# Altium schematic sheet 6.Connectors.SchDoc
size A4; DocumentNumber: 6; SheetNumber: 6
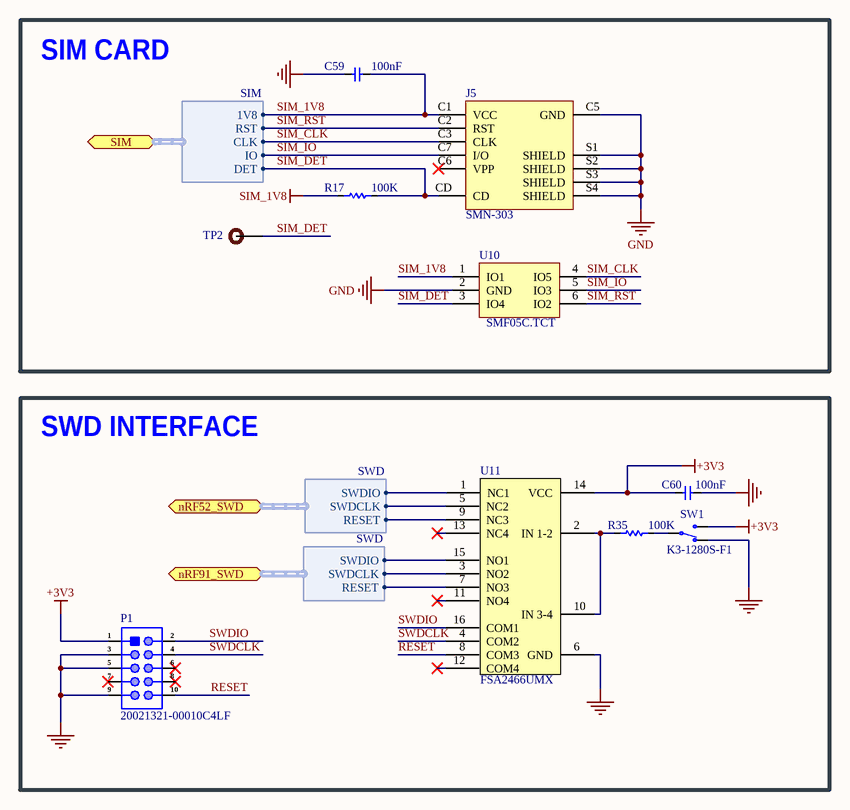
[diagram p0: 6.Connectors.SchDoc]

## Parts
C59  100nF  [cap-0402]
C60  100nF  [cap-0402]
J5  SMN-303  [XUNPU_SMN-303]
P1  20021321-00010C4LF  [20021321-00010C4LF]
R17  100K  [Res-0402]
R35  100K  [Res-0402]
SW1  K3-1280S-F1  [K3-1280S-F1]
TP2  TEST POINT 0.5mm Dia  [Test-point - 0.5mm]  (value not drawn)  (no BOM)
U10  SMF05C.TCT  [SOT65P210X110-6N]
U11  FSA2466UMX  [XQFN40P180X260X50-16N]

## Blocks framed on the sheet
SIM CARD: C59 J5 R17 TP2 U10
SWD INTERFACE: C60 P1 R35 SW1 U11

## Ports
nRF52_SWD (bidir, harness SWD), nRF91_SWD (bidir, harness SWD), SIM (bidir, harness SIM)

## Harnesses
SIM: DET, RST, CLK, IO, 1V8
SWD: SWDIO, SWDCLK, RESET

## Nets
+3V3: C60.1 P1.1 SW1.3(N.O) U11.14(VCC)
GND: C59.1 C60.2 J5.C5(GND) J5.S1(SHIELD) J5.S2(SHIELD) J5.S3(SHIELD) J5.S4(SHIELD) P1.3 P1.5 P1.9 SW1.1(N.C) U10.2(GND) U11.6(GND)
SIM_1V8: C59.2 J5.C1(VCC) R17.1 U10.1(IO1) ; port SIM.1V8
RESET: P1.10 U11.8(COM3)
SIM_CLK: J5.C3(CLK) U10.4(IO5) ; port SIM.CLK
SIM_DET: J5.CD R17.2 TP2.1 U10.3(IO4) ; port SIM.DET
SIM_IO: J5.C7(I/O) U10.5(IO3) ; port SIM.IO
SIM_RST: J5.C2(RST) U10.6(IO2) ; port SIM.RST
SWDCLK: P1.4 U11.4(COM2)
SWDIO: P1.2 U11.16(COM1)
NetR35_1: R35.1 U11.2(IN_1-2) U11.10(IN_3-4)
NetR35_2: R35.2 SW1.2(COM)
NetU11_1: U11.1(NC1) ; port nRF52_SWD.SWDIO
NetU11_3: U11.3(NO2) ; port nRF91_SWD.SWDCLK
NetU11_5: U11.5(NC2) ; port nRF52_SWD.SWDCLK
NetU11_7: U11.7(NO3) ; port nRF91_SWD.RESET
NetU11_9: U11.9(NC3) ; port nRF52_SWD.RESET
NetU11_15: U11.15(NO1) ; port nRF91_SWD.SWDIO

Not connected (* = marked no-connect by the designer): J5 C6(VPP)*; P1 6* 7* 8*; U11 11(NO4)* 12(COM4)* 13(NC4)*

## Notes on the sheet
- ZyntelliTech
- File:
- Title:
- Date:
- Page
- Num:
- Total:
- Drawn By: Huzaifa Ali

## Library data of the parts
C59 C60 = C1005X7R1H104KT000F: CAP CER 0.1UF 50V X7R 0402; Manufacturer: TDK; Tolerance: 10%; Voltage: 25V; Item Type: Capacitor; ComponentLink1URL: https://www.lcsc.com/product-detail/Multilayer-Ceramic-Capacitors-MLCC-SMD-SMT_TDK-C1005X7R1H104KT000F_C361198.html; ComponentLink1Description: LCSC; Supplier 1: Avnet; Manufacturer Part Number: C1005X7R1H104KT000F; RoHS: No; Category: Ceramic Capacitors; Dielectric: X7R; Supplier Part Number 1: C1005X7R1H104KT000F; LCSC Part Number: C361198
J5 = SMN-303: NanoSIM SMD SIM Card Connectors; Manufacturer: XUNPU; Alternate Part Number: SIM8066-6-1-14-01-A; Manufacturer Part Number: SMN-303; Supplier 1: LCSC; LCSC: C266888
P1 = 20021321-00010C4LF: CONN RCPT 10POS 0.05 GOLD SMD; Manufacturer: Amphenol Communications Solutions; Item Type: Headers and Wire Housings; Gender: 4472Gender; Connector Type: 4640ConnectorType; Current Rating: 1A; Number of Contacts: 10NUMBER; Voltage Rating: 125V; Contact Resistance: 30mR; Insulation Resistance: 100MR; Pitch: 1.27mm; Stack Height: 4.3mm; Supplier: Digikey; LCSC Part Number: C598542; Manufacturer Part Number: 20021321-00010C4LF; RoHS: No; Stock: 9747; Pricing: 1=1.13, 10=0.963, 100=0.8184 (USD); Mounting Technology: 8Mount; Pins: 10NUMBER; Color: 46Colour; Contact Material: 153,157ConductorMaterial; Contact Plating: 157ConductorMaterial; Housing Color: 46Colour; Housing Material: 4896ConductorMaterial; Min Operating Temperature: -55°C; Max Operating Temperature: 125°C; Number of Positions: 10NUMBER; Number of Rows: 2NUMBER; Packaging: 10Packaging; Termination: 4558ConnectorType; Max Voltage Rating (AC): 125V; Length: 13.16mm; Height: 4.75mm; Depth: 3mm; Row Spacing: 1.27mm; Lead Free: 5697LeadFree; Reach SVHC Compliant: 4186SVHC; ComponentLink1URL: https://datasheet.octopart.com/20021321-00010C4LF-FCI-datasheet-27119701.pdf?src-supplier=Newark; ComponentLink1Description: https://datasheet.octopart.com/20021321-00010C4LF-FCI-datasheet-27119701.pdf?src-supplier=Newark; ComponentLink2URL: https://datasheet.octopart.com/20021321-00010C4LF-Amphenol-Communications-Solutions-datasheet-98396828.pdf?src-supplier=Element14; ComponentLink2Description: https://datasheet.octopart.com/20021321-00010C4LF-Amphenol-Communications-Solutions-datasheet-98396828.pdf?src-supplier=Element14; ComponentLink3URL: https://datasheet.octopart.com/20021321-00010C4LF-FCI-datasheet-21379677.pdf?src-supplier=Farnell; ComponentLink3Description: https://datasheet.octopart.com/20021321-00010C4LF-FCI-datasheet-21379677.pdf?src-supplier=Farnell; ComponentLink4URL: https://datasheet.octopart.com/20021321-00010C4LF-Amphenol-Communications-Solutions-datasheet-100449241.pdf?src-supplier=TME; ComponentLink4Description: https://datasheet.octopart.com/20021321-00010C4LF-Amphenol-Communications-Solutions-datasheet-100449241.pdf?src-supplier=TME
R17 R35 = RC0402FR-07100KL: RES 100K OHM 1% 1/16W 0402; Manufacturer: Yageo; Temperature Coefficient: 100ppm/°C; Power Rating: 63mW; Voltage Rating: 50V; Item Type: Resistor; Resistance: 100kR; RoHS: Yes; Category: Chip SMD Resistors; Case/Package: 0402; Case Code (Metric): 1005; Case Code (Imperial): 0402; Min Operating Temperature: -55°C; Max Operating Temperature: 155°C; Resistor Type: Thick Film; Tolerance: 1%; Packaging: Tape and Reel; Features: Moisture Resistant; Resistance Tolerance: 1%; Height: 0.016inch; Lead Free: Lead Free; RoHS Compliant: Yes; ComponentLink1URL: https://datasheet.ciiva.com/11819/0900766b80c66297-11819452.pdf?src-supplier=RSComponents; ComponentLink1Description: https://datasheet.ciiva.com/11819/0900766b80c66297-11819452.pdf?src-supplier=RSComponents; ComponentLink2URL: https://datasheet.ciiva.com/22747/1018594-22747509.pdf?src-supplier=Element14; ComponentLink2Description: https://datasheet.ciiva.com/22747/1018594-22747509.pdf?src-supplier=Element14; ComponentLink3URL: https://datasheet.ciiva.com/2453/pyu-r-int-thick-7-2453362.pdf?src-supplier=Digi-Key; ComponentLink3Description: https://datasheet.ciiva.com/2453/pyu-r-int-thick-7-2453362.pdf?src-supplier=Digi-Key; ComponentLink4URL: https://datasheet.ciiva.com/2453/pyu-r-int-thick-7-2453363.pdf?src-supplier=Digi-Key; ComponentLink4Description: https://datasheet.ciiva.com/2453/pyu-r-int-thick-7-2453363.pdf?src-supplier=Digi-Key; ComponentLink5URL: https://datasheet.ciiva.com/2453/pyu-r-int-thick-7-2453361.pdf?src-supplier=Digi-Key; ComponentLink5Description: https://datasheet.ciiva.com/2453/pyu-r-int-thick-7-2453361.pdf?src-supplier=Digi-Key; ComponentLink6URL: https://datasheet.ciiva.com/12667/pyu-rc0402-51-rohs-l-6-r-12667930.pdf?src-supplier=Mouser; ComponentLink6Description: https://datasheet.ciiva.com/12667/pyu-rc0402-51-rohs-l-6-r-12667930.pdf?src-supplier=Mouser; ComponentLink7URL: https://datasheet.ciiva.com/15189/getdatasheetpartid-323696-15189334.pdf?src-supplier=Verical; ComponentLink7Description: https://datasheet.ciiva.com/15189/getdatasheetpartid-323696-15189334.pdf?src-supplier=Verical; LCSC Part Number: C60491; Supplier 1: Mouser; Manufacturer Part Number: RC0402FR-07100KL; Stock 1: 7759549; Pricing 1: 1=0.10000, 10=0.01200, 50=0.01200, 100=0.00500, 1000=0.00300, 2500=0.00200, 10000=0.00100 (USD); Package Quantity: 1; Number of Terminations: 2; Termination: SMD/SMT; Max Power Dissipation: 63mW; Working Voltage: 50V; Series: RC; Construction: Rectangular; Technology: THICK FILM; Length: 0.039inch; Width: 0.02inch; Depth: 0.5mm; REACH SVHC: No SVHC; Military Standard: Not; Supplier Part Number 1: 603-RC0402FR-07100KL
SW1 = AYZ0102AGRLC: Miniature slide switch, SPDT, Right-Angle, ON-ON, 12V, 100mA; ComponentLink1URL: https://www.ckswitches.com/media/1431/ayz.pdf; ComponentLink1Description: Datasheet; ComponentLink2URL: N.A.; ComponentLink2Description: Supplier link; Digikey Part Number: 401-2012-1-ND; LCSC: C92658
TP2 = TEST POINT 0.5mm Dia: Test Point ON; Item Type: Test Point; Manufacturer Part Number: TEST POINT 0.5mm Dia
U10 = SMF05C.TCT: TVS DIODE 5VWM 12.5VC SC70-6; Manufacturer: Semtech; Direction: Unidirectional; Capacitance: 130pF; Reverse Breakdown Voltage: 6V; Number of Elements: 5; Element Configuration: Common Anode; Reverse Standoff Voltage: 5V; Clamping Voltage: 12.5V; Peak Pulse Power: 100W; Power Line Protection: No; Leakage Current: 5uA; Peak Pulse Current: 8A; Test Current: 1mA; ESD Protection: Yes; Diode Type: ZENER; Supplier 1: Digi-Key; Supplier Part Number 1: SMF05CCT-ND; Manufacturer Part Number: SMF05C.TCT; RoHS: Yes; Category: TVS Diodes; Stock 1: 164885; Pricing 1: 1=0.79000, 10=0.69300, 100=0.53130, 500=0.42000, 1000=0.33600 (USD); Mount: Surface Mount; Case/Package: SC; Number of Pins: 6; Min Operating Temperature: -55°C; Max Operating Temperature: 125°C; Packaging: Tape and Reel; Number of Channels: 5; Number of Unidirectional Channels: 5; Min Breakdown Voltage: 6V; Working Voltage: 5V; Polarity: Unidirectional; Max Reverse Leakage Current: 5uA; Max Breakdown Voltage: 6V; Voltage Rating (DC): 5V; Operating Supply Voltage: 5V; Resistor Type: Zener; Series: SMF; Clamping Voltage-Max: 12.5V; Length: 2mm; Width: 1.25mm; Height: 0.9mm; Depth: 1.25mm; Radiation Hardening: No; Lead Free: Lead Free; RoHS Compliant: Yes; ComponentLink1URL: https://datasheet.ciiva.com/338/smf05c-338385.pdf?src-supplier=Digi-Key; ComponentLink1Description: https://datasheet.ciiva.com/338/smf05c-338385.pdf?src-supplier=Digi-Key; ComponentLink2URL: https://datasheet.ciiva.com/18065/getdatasheetpartid-89007-18065142.pdf?src-supplier=Verical; ComponentLink2Description: https://datasheet.ciiva.com/18065/getdatasheetpartid-89007-18065142.pdf?src-supplier=Verical; ComponentLink3URL: https://datasheet.ciiva.com/338/smf05c-338386.pdf?src-supplier=Digi-Key; ComponentLink3Description: https://datasheet.ciiva.com/338/smf05c-338386.pdf?src-supplier=Digi-Key; ComponentLink4URL: https://datasheet.ciiva.com/338/smf05c-338387.pdf?src-supplier=Digi-Key; ComponentLink4Description: https://datasheet.ciiva.com/338/smf05c-338387.pdf?src-supplier=Digi-Key; ComponentLink5URL: https://datasheet.ciiva.com/16387/smf05c-16387308.pdf?src-supplier=Future+Electronics; ComponentLink5Description: https://datasheet.ciiva.com/16387/smf05c-16387308.pdf?src-supplier=Future+Electronics; LCSC: C85191
U11 = FSA2466UMX: Data / Audio Low-Voltage Dual DPDT Analog Switch; Manufacturer: ON Semiconductor; Part number IPS: 00000009986; Note: N.A.; Artikkelnr Noca: 15070069; Pad Count: 16; Part Number: FSA2466UMX; Manufacturer Part Number: FSA2466UMX; ComponentLink1URL: N.A.; ComponentLink1Description: Datasheet; ComponentLink2URL: N.A.; ComponentLink2Description: Supplier link; HelpURL: https://www.onsemi.com/pub/Collateral/FSA2466-D.PDF; Footprint Doc: UFQFN-16; LatestRevisionDate: 2019-05-15; Published: 2016-05-18; Value: FSA2466UMX; Supplier 1: Digi-Key; Supplier Part Number 1: FSA2466UMXCT-ND; Supplier 2: Mouser; Supplier Part Number 2: 512-FSA2466UMX; Component Class: Misc_ICs; PartId: 101900422; LCSC: C457657